# Altium schematic sheet Top-Sheet.SchDoc
size A4; SheetNumber: 1
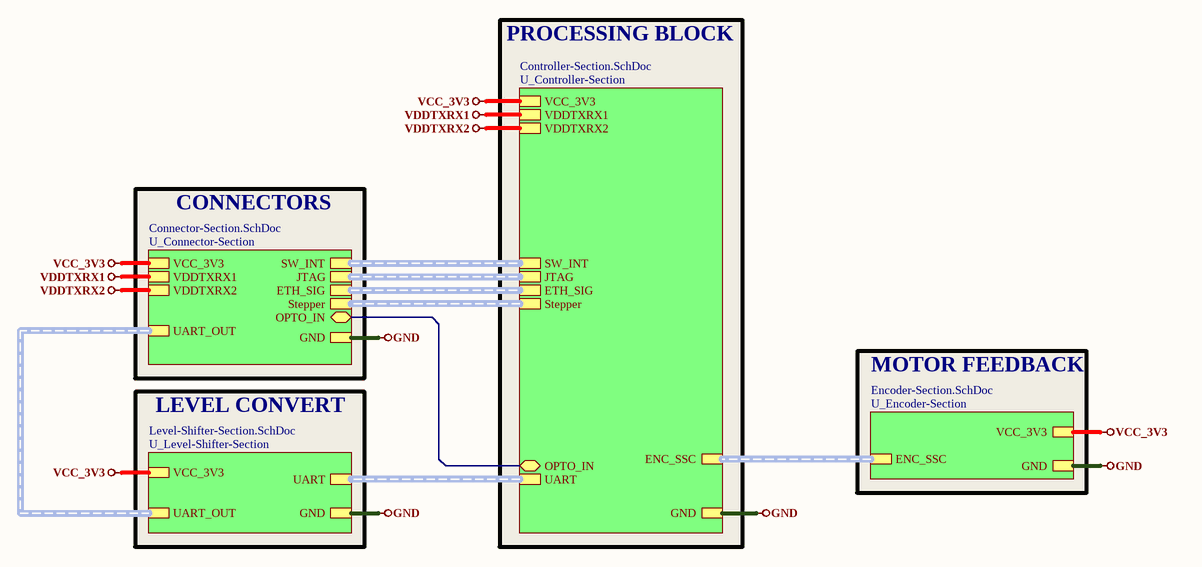
[diagram p0: Top-Sheet.SchDoc]

## Sub-sheets
U_Connector-Section = Connector-Section.SchDoc: SW_INT (harness SW_INT), JTAG (harness JTAG), ETH_SIG (harness ETH_SIG), VCC_3V3, GND, VDDTXRX1, VDDTXRX2, Stepper (harness Stepper), OPTO_IN (bidir), UART_OUT (harness UART_OUT)
U_Controller-Section = Controller-Section.SchDoc: JTAG (harness JTAG), SW_INT (harness SW_INT), ETH_SIG (harness ETH_SIG), Stepper (harness Stepper), VCC_3V3, ENC_SSC (harness ENC_SSC), UART (harness UART), GND, OPTO_IN (bidir), VDDTXRX1, VDDTXRX2
U_Encoder-Section = Encoder-Section.SchDoc: VCC_3V3, GND, ENC_SSC (harness ENC_SSC)
U_Level-Shifter-Section = Level-Shifter-Section.SchDoc: UART (harness UART), VCC_3V3, GND, UART_OUT (harness UART_OUT)

## Nets
GND: sheet U_Connector-Section/GND, sheet U_Level-Shifter-Section/GND, sheet U_Controller-Section/GND, sheet U_Encoder-Section/GND
VCC_3V3: sheet U_Connector-Section/VCC_3V3, sheet U_Level-Shifter-Section/VCC_3V3, sheet U_Controller-Section/VCC_3V3, sheet U_Encoder-Section/VCC_3V3
VDDTXRX1: sheet U_Connector-Section/VDDTXRX1, sheet U_Controller-Section/VDDTXRX1
VDDTXRX2: sheet U_Connector-Section/VDDTXRX2, sheet U_Controller-Section/VDDTXRX2
(unnamed): sheet U_Connector-Section/OPTO_IN, sheet U_Controller-Section/OPTO_IN

## Buses and harness runs
harness sheet U_Connector-Section/ETH_SIG = sheet U_Controller-Section/ETH_SIG
harness sheet U_Connector-Section/JTAG = sheet U_Controller-Section/JTAG
harness sheet U_Connector-Section/Stepper = sheet U_Controller-Section/Stepper
harness sheet U_Connector-Section/SW_INT = sheet U_Controller-Section/SW_INT
harness sheet U_Connector-Section/UART_OUT = sheet U_Level-Shifter-Section/UART_OUT
harness sheet U_Controller-Section/ENC_SSC = sheet U_Encoder-Section/ENC_SSC
harness sheet U_Controller-Section/UART = sheet U_Level-Shifter-Section/UART

## Notes on the sheet
- PROCESSING BLOCK
- CONNECTORS
- MOTOR FEEDBACK
- LEVEL CONVERT